# Altium schematic sheet 02.C207. A01-A21. Module BASU signals OPK.SchDoc: Кабель энкодера ОЭК
size 209 x 297 mm; Author: Мурашкин Д.В.; Address1: Address1; Address2: Address2; Address3: Address3; Address4: Address4; DocumentNumber: ИЗДЕЛИЕ-1-2; SheetNumber: 19; Scale: 1:1; Letter1Column: Э
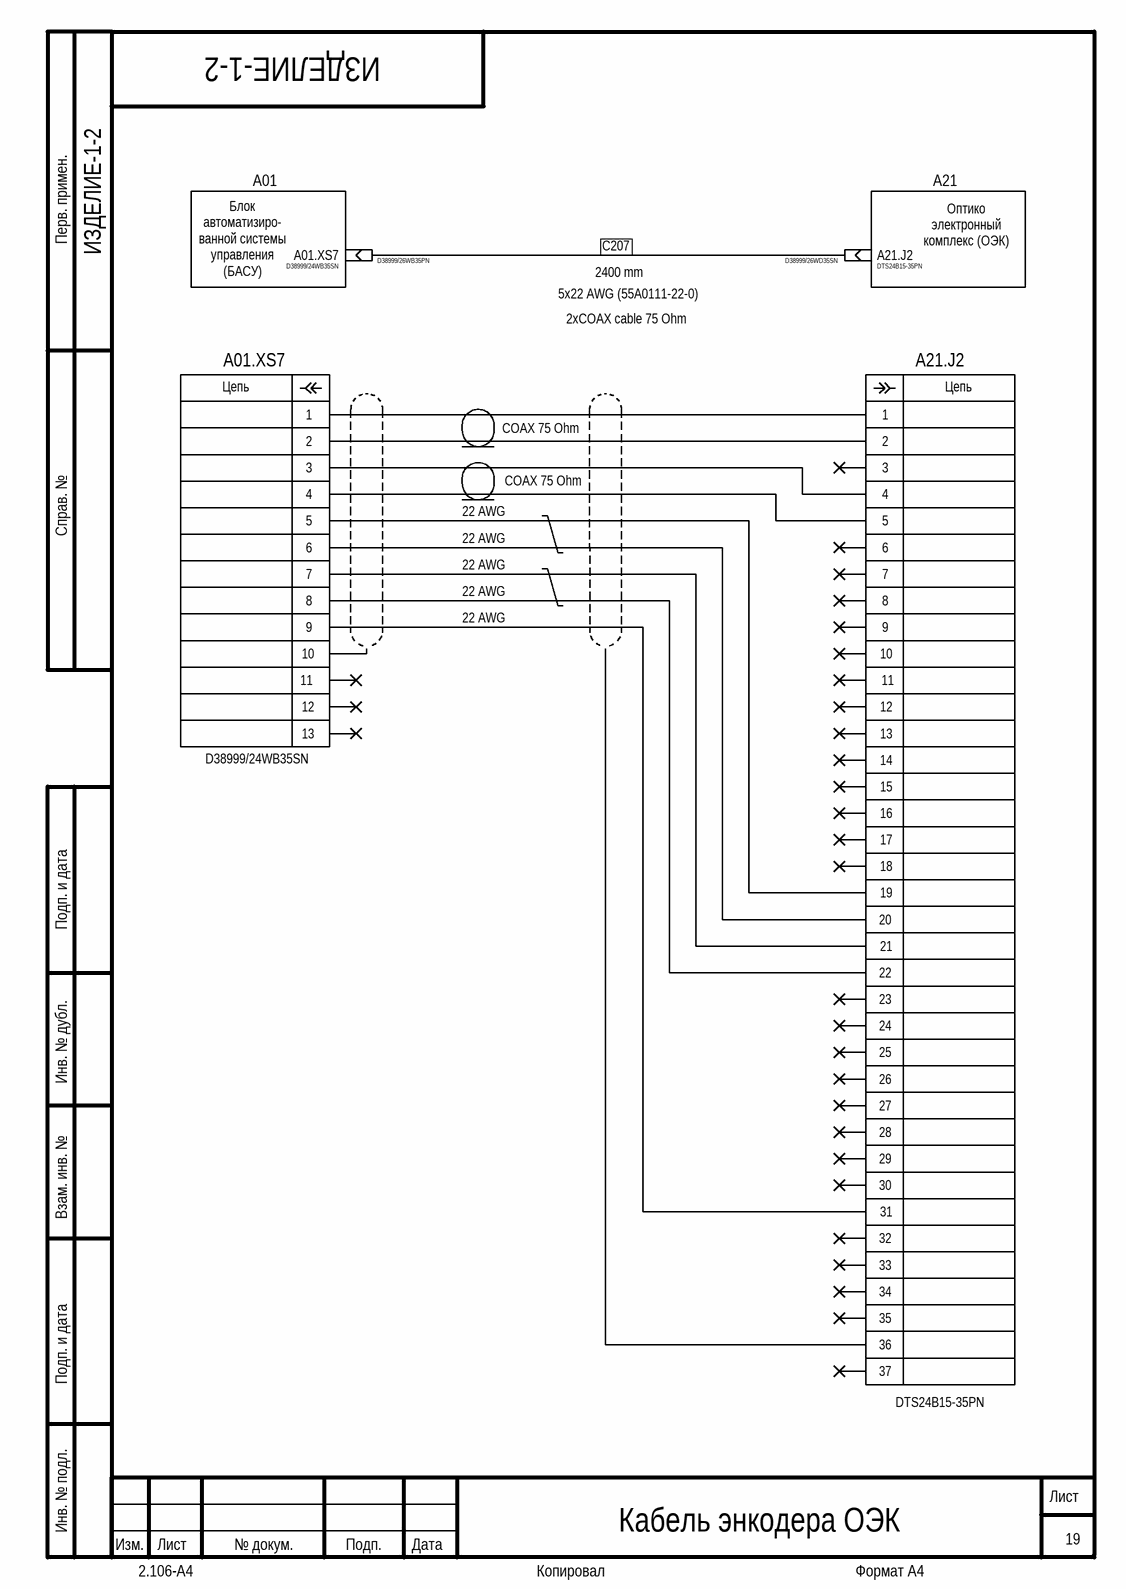
[diagram p0: 02.C207. A01-A21. Module BASU signals OPK.SchDoc]

## Parts
(Parts that share a designator on the sheet are numbered #1, #2 ... from top to bottom, then left to right.)
A01.XS7#1  D38999/24WB35SN
A01.XS7#2  D38999/24WB35SN
A21.J2#1  DTS24B15-35PN  (no BOM)
A21.J2#2  DTS24B15-35PN
A?#1  D38999/26WB35PN
A?#2  D38999/26WD35SN

## Blocks framed on the sheet
A21: A21.J2#1

## Nets
С207: A?#1.0 A?#2.0
NetA01.XS7#2_1: A01.XS7#2.1 A21.J2#2.1
NetA01.XS7#2_2: A01.XS7#2.2 A21.J2#2.2
NetA01.XS7#2_3: A01.XS7#2.3 A21.J2#2.4
NetA01.XS7#2_4: A01.XS7#2.4 A21.J2#2.5
NetA01.XS7#2_5: A01.XS7#2.5 A21.J2#2.19
NetA01.XS7#2_6: A01.XS7#2.6 A21.J2#2.20
NetA01.XS7#2_7: A01.XS7#2.7 A21.J2#2.21
NetA01.XS7#2_8: A01.XS7#2.8 A21.J2#2.22
NetA01.XS7#2_9: A01.XS7#2.9 A21.J2#2.31

Not connected (* = marked no-connect by the designer): A01.XS7#1 0; A01.XS7#2 10 11* 12* 13*; A21.J2#1 0; A21.J2#2 3* 6* 7* 8* 9* 10* 11* 12* 13* 14* 15* 16* 17* 18* 23* 24* 25* 26* 27* 28* 29* 30* 32* 33* 34* 35* 36 37*

## Notes on the sheet
- A01
- (near A21.J2#1) Оптико электронный комплекс (ОЭК)
- Блок автоматизиро- ванной системы управления (БАСУ)
- 5x22 AWG (55A0111-22-0)
- 2400 mm
- 2xCOAX cable 75 Ohm
- COAX 75 Ohm
- 22 AWG
- Перв. примен.
- Справ. №
- Подп. и дата
- Инв. № дубл.
- Взам. инв. №
- Инв. № подл.
- Изм.
- Лист
- № докум.
- Подп.
- Дата
- 2.106-A4
- Копировал
- Формат А4
- (in symbol Connector signal P13) Цепь
- (in symbol Connector signal P37 MIL) Цепь

## Library data of the parts
A01.XS7#1 A?#2 = Connector cable socket: Operating temperature: -°C +°C; Mounting type: Surface mount; Dimension: .0mm x .0mm; Height: .0mm
  A01.XS7#1: Part name: D38999/24WB35SN
  A?#2: Part name: D38999/26WD35SN
A01.XS7#2 = Connector signal P13: P13 MIL; Operating temperature: -°C +°C; Mounting type: Surface mount; Dimension: .0mm x .0mm; Height: .0mm
A21.J2#1 A?#1 = Connector cable plug: Operating temperature: -°C +°C; Mounting type: Surface mount; Dimension: .0mm x .0mm; Height: .0mm
  A21.J2#1: Part name: DTS24B15-35PN
  A?#1: Part name: D38999/26WB35PN
A21.J2#2 = Connector signal P37 MIL: P37 MIL; Operating temperature: -°C +°C; Mounting type: Surface mount; Dimension: .0mm x .0mm; Height: .0mm